# Altium schematic sheet 100_AC-DC.SchDoc: AC-DC Convertion stages
size A4; Date: xxxxxx; DrawnBy: H.Y.Pabón; Revision: V1R0; SheetNumber: 2; SheetTotal: 4
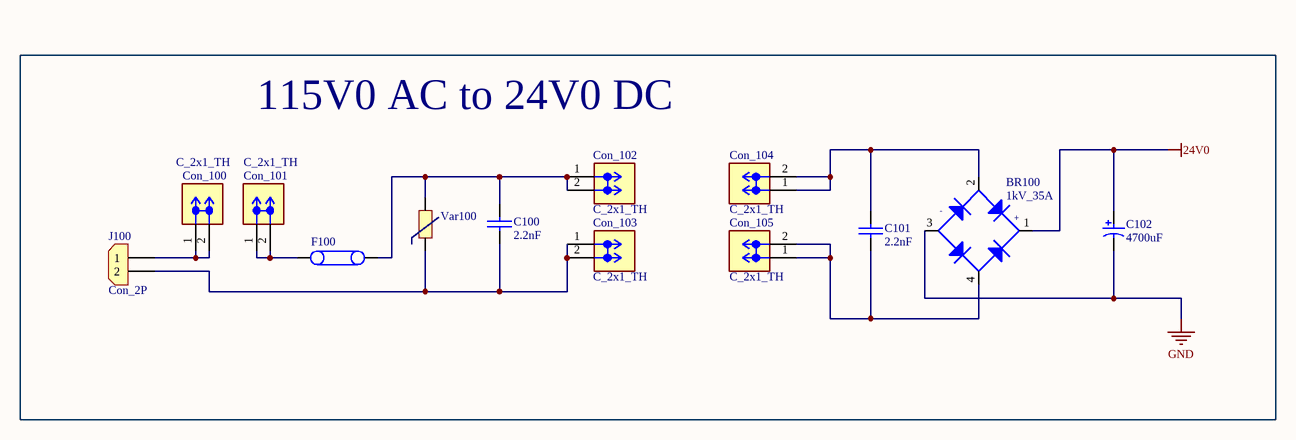
[diagram p0: 100_AC-DC.SchDoc]

## Parts
BR100  1kV_35A  [BR_1kV_35A_GBPC-W]
C100  value 2.2nF  [Cap_2.2nF_300V]  (hidden comment: 2.2nF_300V)
C101  value 2.2nF  [Cap_2.2nF_300V]  (hidden comment: 2.2nF_300V)
C102  value 4700uF  [C_4700uF_63V_Electrolytic]  (hidden comment: 4700uF_63V)
Con_100  C_2x1_TH  [Con_2x1_TH_6.3mm]
Con_101  C_2x1_TH  [Con_2x1_TH_6.3mm]
Con_102  C_2x1_TH  [Con_2x1_TH_6.3mm]
Con_103  C_2x1_TH  [Con_2x1_TH_6.3mm]
Con_104  C_2x1_TH  [Con_2x1_TH_6.3mm]
Con_105  C_2x1_TH  [Con_2x1_TH_6.3mm]
F100  500V 10A  [FUSE_HLD_CARTRIDGE_5x20mm]  (value not drawn)
J100  Con_2P  [CON_2x1_TH_3.5mm_TB]
Var100  VAR_423V~517V_6.5kA  [VARISTOR 423V~517V 6.5kA P=10mm]  (value not drawn)

## Blocks framed on the sheet
115V0 AC to 24V0 DC: BR100 C100-C102 Con_100-Con_105 F100 J100 Var100

## Nets
24V0: BR100.1 C102.1
GND: BR100.3 C102.2
NetBR100_2: BR100.2 C101.1 Con_104.1 Con_104.2
NetBR100_4: BR100.4 C101.2 Con_105.1 Con_105.2
NetC100_1: C100.1 Con_102.1 Con_102.2 F100.2 Var100.2
NetC100_2: C100.2 Con_103.1 Con_103.2 J100.2 Var100.1
NetCon_100_1: Con_100.1 Con_100.2 J100.1
NetCon_101_1: Con_101.1 Con_101.2 F100.1

## Notes on the sheet
- Title:
- Project:
- File:
- Revision:
- Date:
- Size:
- A4
- Drawn by:
- (in symbol BR_1kV_35A_GBPC-W) -; +

## Library data of the parts
BR100 = BR_1kV_35A_GBPC-W: BRIDGE RECT 1kV 35A GBPC-W; Manufacturer: VISHAY; Manufacturer Part Number: GBPC3510W-E4/51; Supplier 1: LCSC; Supplier Part Number 1: C435891; Reel Stock: N/A; Last modified by: H.Y.Pabón; Last modified date: 20261030; ComponentLink1Description: LCSC; ComponentLink1URL: https://www.lcsc.com/es/product-detail/C435891.html?s_z=n_q_GBPC3510&spm=wm.fly.bg.0.xh&lcsc_vid=TwUMAgFRQ1ZdBABSRVJXAwZQE1ANUAIARVkMAlZRRVUxVlNfRFJWV1RXRVBZUjsOAxUeFF5JWBYZEEoKFBINSQcJGk4LFEsFFhULAAsUDk5fVVBIHxUDCw%3D%3D; ComponentLink2Description: DataSheet; ComponentLink2URL: https://www.lcsc.com/datasheet/C435891.pdf?spm=wm.sxq.inf.ggs___wm.fly.bg.0.xh&lcsc_vid=TwUMAgFRQ1ZdBABSRVJXAwZQE1ANUAIARVkMAlZRRVUxVlNfRFJWV1RXRVBZUjsOAxUeFF5JWBYZEEoKFBINSQcJGk4LFEsFFhULAAsUDk5fVVBIHxUDCw%3D%3D
C100 C101 = Cap_2.2nF_300V_TH: CAP SAFETY 2.2nF ±10% 300V TH; Manufacturer: TDK; Manufacturer Part Number: B32021A3222K000; Supplier 1: LCSC; Supplier Part Number 1: C341260; Reel stock: N/A; Last modified by: H.Y.Pabón; Last modified date: 20261111; ComponentLink1Description: LCSC; ComponentLink1URL: https://www.lcsc.com/es/product-detail/C341260.html?s_z=n_q_t_y2%2520capacitor&spm=wm.fly.bg.0.xh&lcsc_vid=Q1RbAgBVRVQPAlZeQVRYVAdeFgVZXwFeTgNaVQJTEwUxVlNfQ1VaXlJRT1dbVzsOAxUeFF5JWBYZEEoKFBINSQcJGk4LFEsVEgAcBAw%3D; ComponentLink2Description: DataSheet; ComponentLink2URL: https://www.lcsc.com/datasheet/C341260.pdf?spm=wm.sxq.inf.ggs___wm.fly.bg.0.xh&lcsc_vid=Q1RbAgBVRVQPAlZeQVRYVAdeFgVZXwFeTgNaVQJTEwUxVlNfQ1VaXlJRT1dbVzsOAxUeFF5JWBYZEEoKFBINSQcJGk4LFEsVEgAcBAw%3D
C102 = C_4700uF_63V_Electrolytic: 4700 µF 63 V Aluminum Electrolytic Capacitors Radial, Can - Snap-In 3000 Hrs @ 105°C; Manufacturer: Nichicon; Manufacturer Part Number: LGU1J472MELC; Supplier 1: Digi-Key; Supplier Part Number 1: 493-8446-ND; Reel stock: N/A; Last modified by: H.Y.Pabón; Last modified date: 20261030; ComponentLink1Description: DIGIKEY; ComponentLink1URL: https://www.digikey.com/en/products/detail/nichicon/LGU1J472MELC/2540661; ComponentLink2Description: DataSheet; ComponentLink2URL: https://www.nichicon.co.jp/english/series_items/catalog_pdf/e-lgu.pdf
Con_100-Con_105 = Con_2x1_TH_6.3mm: Through Hole Quick Connects, Quick Disconnect Connectors RoHS; Manufacturer: TE Connectivity; Manufacturer Part Number: 2376591-2; Supplier 1: LCSC; Supplier Part Number 1: C3218571; Reel Stock: N/A; Last modified by: H.Y.Pabón; Last modified date: 20261111; ComponentLink1Description: LCSC; ComponentLink1URL: https://www.lcsc.com/es/product-detail/C3218571.html?s_z=n_q_2376591-2&spm=wm.fly.bg.0.xh&lcsc_vid=Q1RbAgBVRVQPAlZeQVRYVAdeFgVZXwFeTgNaVQJTEwUxVlNfQ1VaVVBVQVBcUTsOAxUeFF5JWBYZEEoKFBINSQcJGk4LFEsFFhULAAsUDk5fXldSWQkaCgg%3D; ComponentLink2Description: DataSheet; ComponentLink2URL: https://www.lcsc.com/datasheet/C3218571.pdf?spm=wm.sxq.inf.ggs___wm.fly.bg.0.xh&lcsc_vid=Q1RbAgBVRVQPAlZeQVRYVAdeFgVZXwFeTgNaVQJTEwUxVlNfQ1VaVVBVQVBcUTsOAxUeFF5JWBYZEEoKFBINSQcJGk4LFEsFFhULAAsUDk5fXldSWQkaCgg%3D
F100 = F_HLD_CARTRIDGE_5x20mm: FUSE BLOK CARTRIDGE 500V 10A PCB; Manufacturer: Schurter Inc.; Manufacturer Part Number: 0031.8201; Supplier 1: Digi-Key; Supplier Part Number 1: 486-1258-ND; Reel Sotck: N/A; Last modified by: J.Jaramillo; Last modified date: 20240309; ComponentLink1Description: Digi-Key; ComponentLink1URL: https://www.digikey.com/en/products/detail/schurter-inc/0031-8201/669925?s=N4IgTCBcDaIAxwMwEYB0AOMdkgLoF8g
J100 = Con_2x1_TH_3.5mm: TERM BLK 2POS SIDE ENT 3.5MM PCB; Manufacturer: Würth Elektronik; Manufacturer Part Number: 691214110002; Supplier 1: Digi-Key; Supplier Part Number 1: 732-2747-ND; Last modified by: J.Jaramillo; Last modified date: 20240310; ComponentLink1Description: Digi-key; ComponentLink1URL: https://www.digikey.com/product-detail/en/wurth-electronics-inc/691214110002/732-2747-ND/2508516; Reel Stock: N/A
Var100 = VAR_423V~517V_6.5kA_TH10mm: VARISTOR 423V~517V 6.5kA P=10mm; Manufacturer: Brightking; Manufacturer Part Number: 471KD20; Supplier 1: LCSC; Supplier Part Number 1: C522652; Reel Sotck: N/A; Last modified by: H.Y.Pabón; Last modified date: 20261111; ComponentLink1Description: LCSC; ComponentLink1URL: https://www.lcsc.com/es/product-detail/C522652.html?s_z=n_q_t_varistor&spm=wm.fly.bg.3.stp___wm.ssy.tc.0.tz&lcsc_vid=Q1RbAgBVRVQPAlZeQVRYVAdeFgVZXwFeTgNaVQJTEwUxVlNfQ1VdXlFQQ1hYUTsOAxUeFF5JWBYZEEoKFBINSQcJGk4LFEsFFhULAAsUDk5fXldSWQkaCgg%3D; ComponentLink2Description: DataSheet; ComponentLink2URL: https://www.lcsc.com/datasheet/C522652.pdf?spm=wm.sxq.inf.ggs___wm.fly.bg.3.stp&lcsc_vid=Q1RbAgBVRVQPAlZeQVRYVAdeFgVZXwFeTgNaVQJTEwUxVlNfQ1VdXlFQQ1hYUTsOAxUeFF5JWBYZEEoKFBINSQcJGk4LFEsFFhULAAsUDk5fXldSWQkaCgg%3D